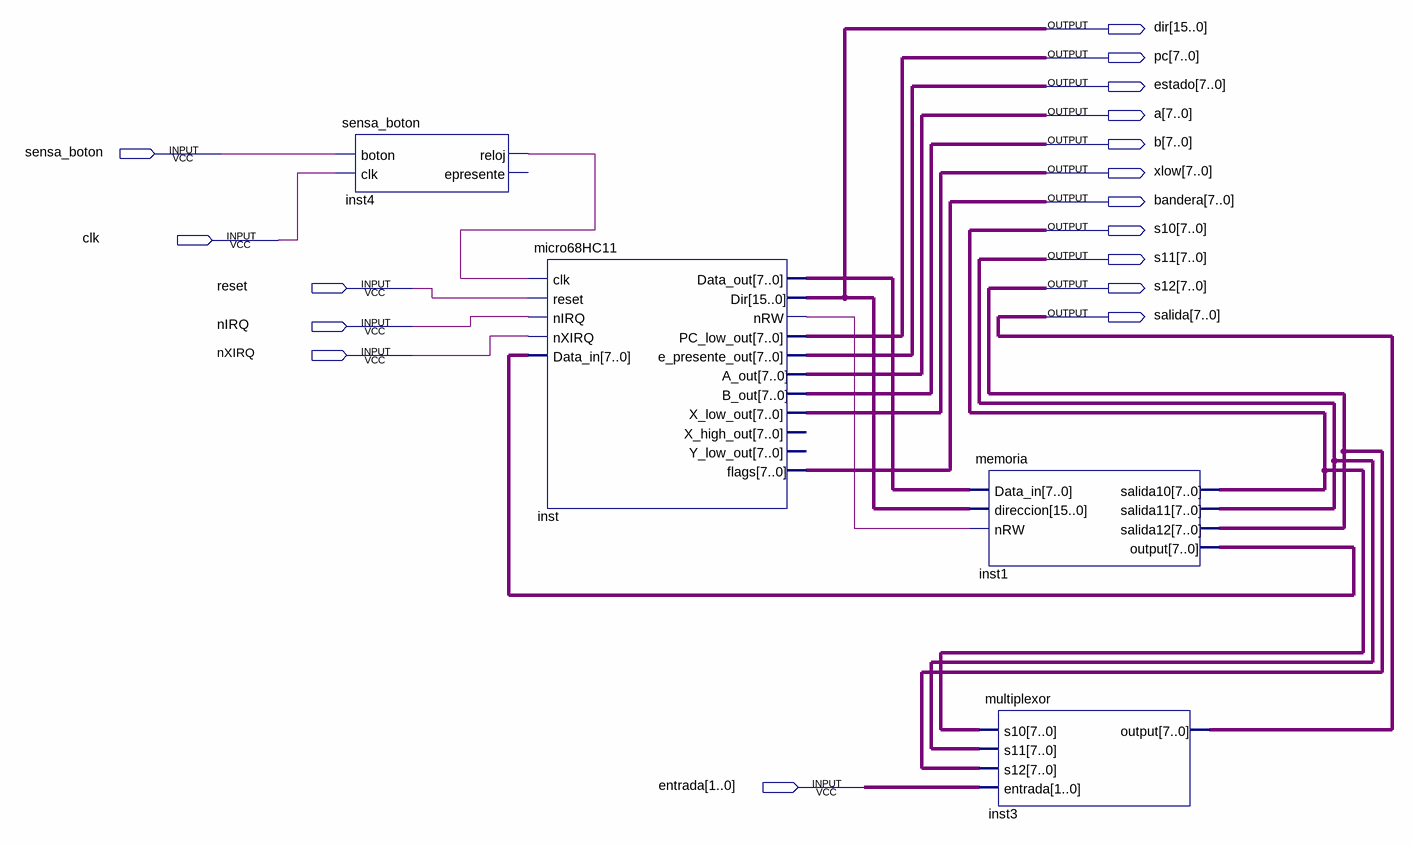
[diagram p0: schematic sheet]
// Quartus schematic practica_06.bdf as structural Verilog: 4 symbols, 17 pins
module practica_06 (
  input  sensa_boton,
  input  clk,
  input  reset,
  input  nIRQ,
  input  nXIRQ,
  input  [1:0] entrada,
  output [15:0] dir,
  output [7:0] pc,
  output [7:0] estado,
  output [7:0] a,
  output [7:0] b,
  output [7:0] xlow,
  output [7:0] bandera,
  output [7:0] s10,
  output [7:0] s11,
  output [7:0] s12,
  output [7:0] salida
);

  wire inst4_reloj, inst_nrw;
  wire [7:0] inst1_output, inst_data_out;

  sensa_boton inst4 (.boton(sensa_boton), .clk(clk), .reloj(inst4_reloj));  // open: epresente
  micro68HC11 inst (
    .clk(inst4_reloj), .reset(reset), .nIRQ(nIRQ), .nXIRQ(nXIRQ), .Data_in(inst1_output),
    .Data_out(inst_data_out), .Dir(dir), .nRW(inst_nrw), .PC_low_out(pc), .e_presente_out(estado), .A_out(a),
    .B_out(b), .X_low_out(xlow), .flags(bandera));  // open: X_high_out, Y_low_out
  memoria inst1 (
    .Data_in(inst_data_out), .direccion(dir), .nRW(inst_nrw), .salida10(s10), .salida11(s11), .salida12(s12),
    .\output (inst1_output));
  multiplexor inst3 (.s10(s10), .s11(s11), .s12(s12), .entrada(entrada), .\output (salida));
endmodule
